# Altium schematic sheet Karta_Radiowa.SchDoc: Karta_L1
size A3
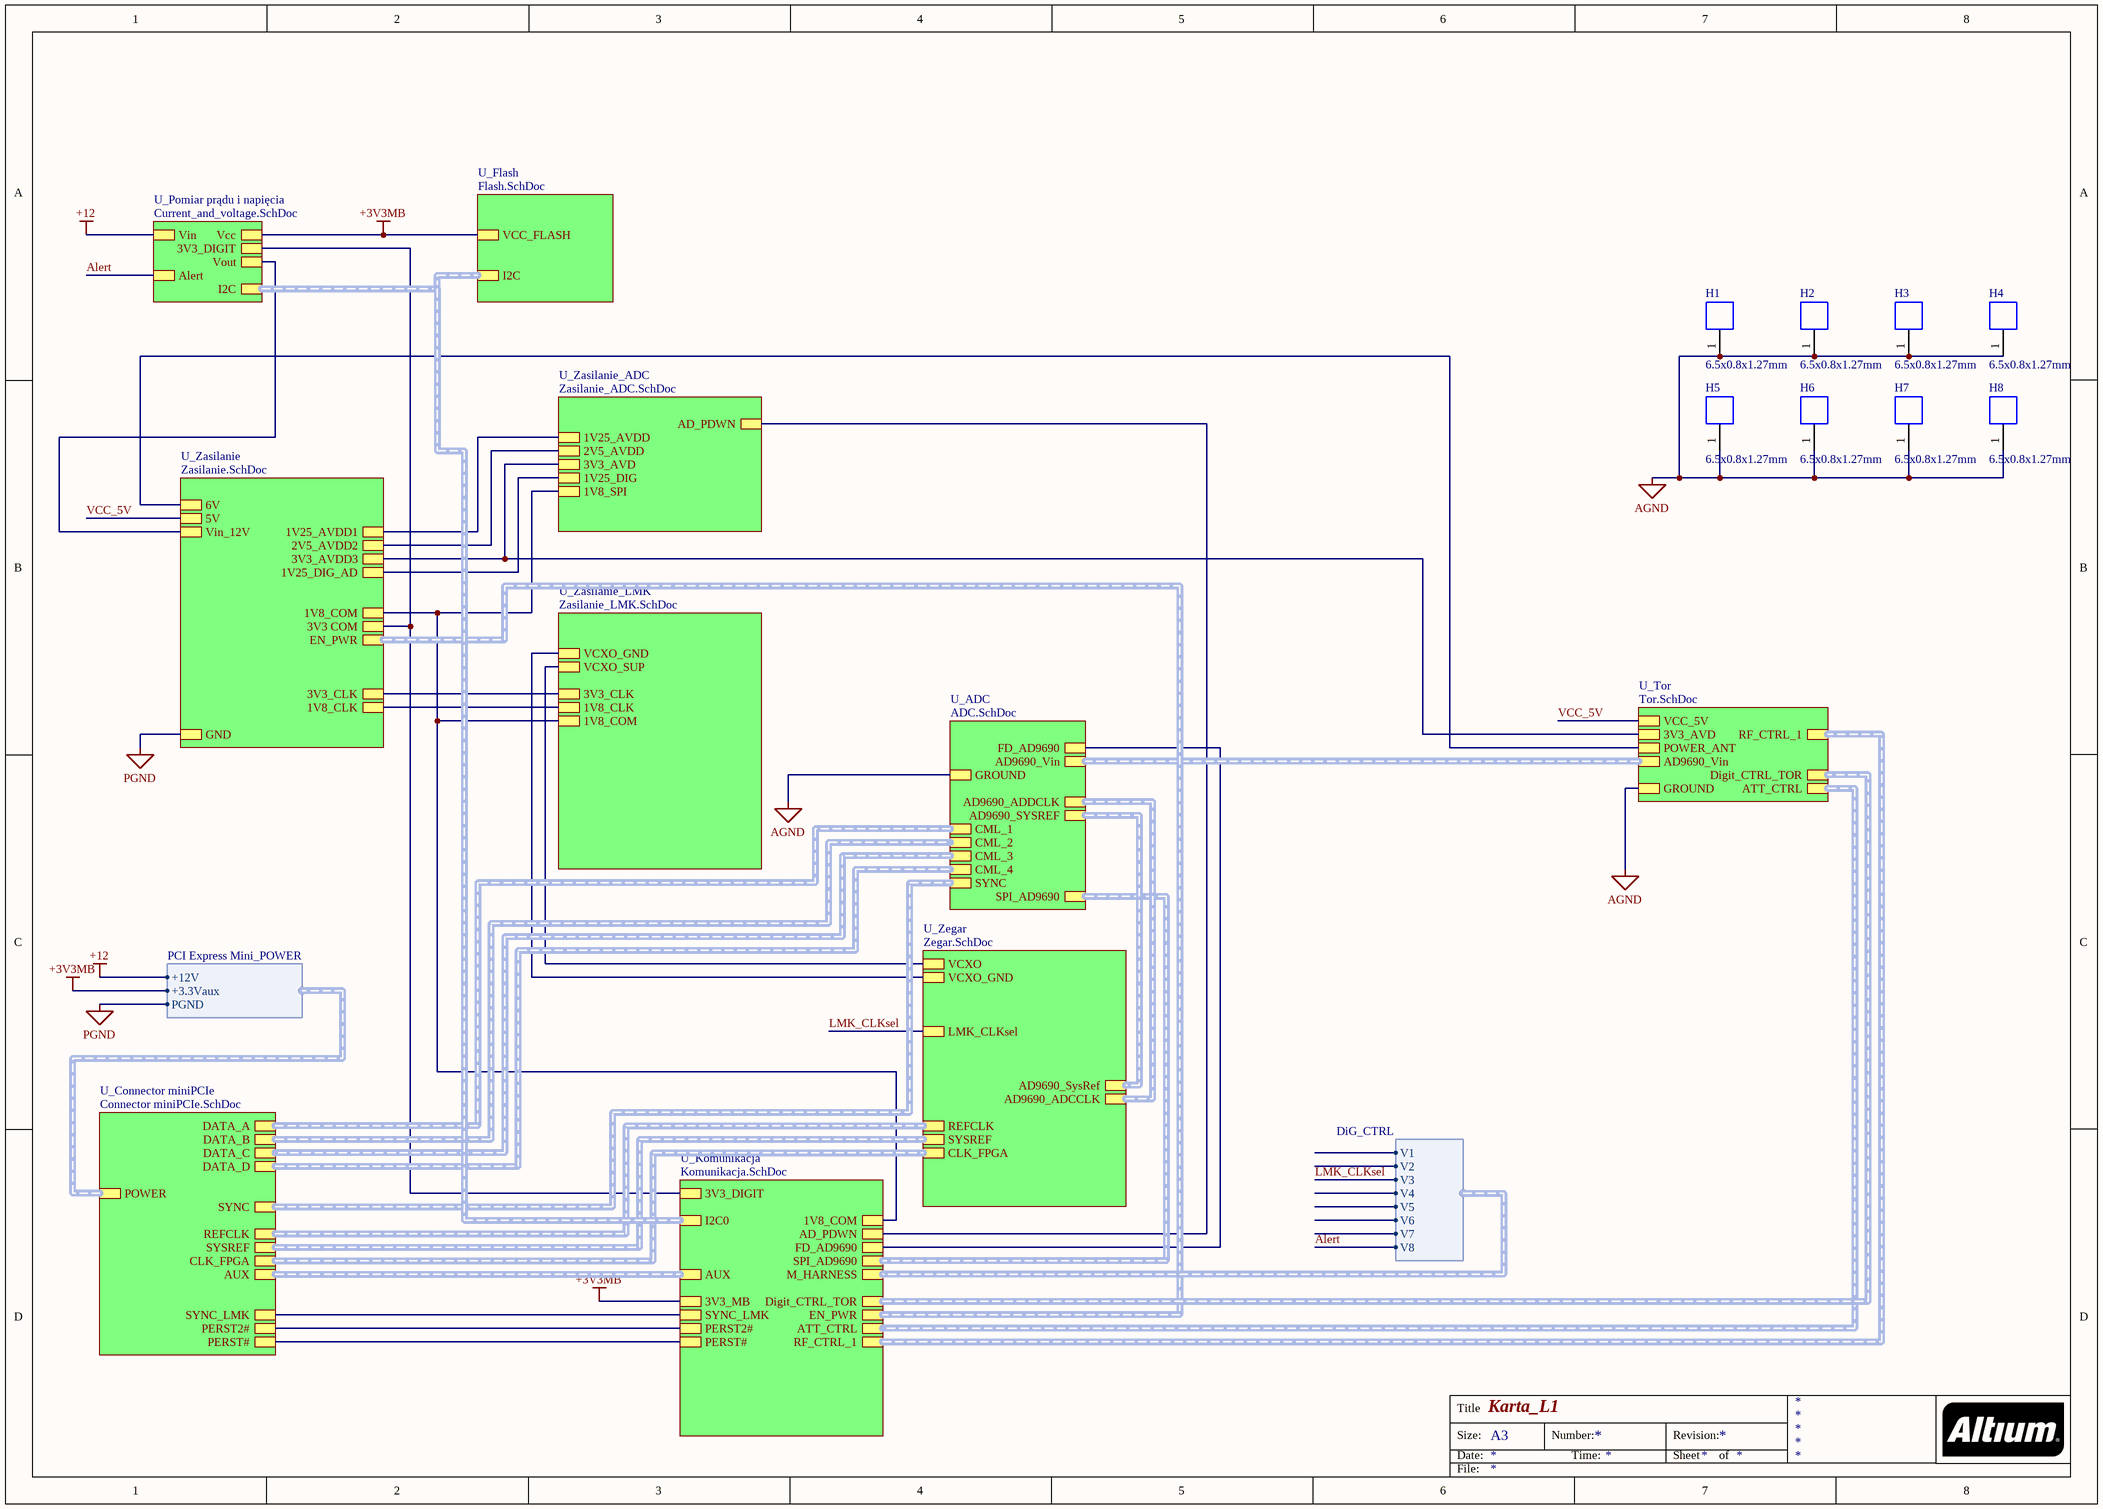
[diagram p0: Karta_Radiowa.SchDoc]

## Parts
H1  6.5x0.8x1.27mm  [36900000]
H2  6.5x0.8x1.27mm  [36900000]
H3  6.5x0.8x1.27mm  [36900000]
H4  6.5x0.8x1.27mm  [36900000]
H5  6.5x0.8x1.27mm  [36900000]
H6  6.5x0.8x1.27mm  [36900000]
H7  6.5x0.8x1.27mm  [36900000]
H8  6.5x0.8x1.27mm  [36900000]

## Sub-sheets
U_ADC = ADC.SchDoc: AD9690_Vin (harness Diff_Anal), GROUND, AD9690_ADDCLK (harness Diff_Dig), AD9690_SYSREF (harness Diff_Digit), CML_4 (harness DATA_OUT), CML_3 (harness DATA_OUT), CML_1 (harness DATA_OUT), CML_2 (harness DATA_OUT), SYNC (harness CLK_DIFF), SPI_AD9690 (harness SPI), FD_AD9690
U_Connector miniPCIe = Connector miniPCIe.SchDoc: POWER (harness PCI Express Mini_POWER), AUX (harness PCI Express Mini_AUXILIARY), REFCLK (harness CLK_DIFF), SYNC (harness CLK_DIFF), SYSREF (harness CLK_DIFF), DATA_A (harness DATA_OUT), PERST#, PERST2#, SYNC_LMK, DATA_B (harness DATA_OUT), DATA_C (harness DATA_OUT), DATA_D (harness DATA_OUT), CLK_FPGA (harness CLK_DIFF)
U_Flash = Flash.SchDoc: VCC_FLASH, I2C (harness I2C)
U_Komunikacja = Komunikacja.SchDoc: I2C0 (harness I2C), PERST#, AUX (harness PCI Express Mini_AUXILIARY), 3V3_MB, PERST2#, SYNC_LMK, 3V3_DIGIT, ATT_CTRL (harness ATT_Controle), Digit_CTRL_TOR (harness DiG_CTRL), EN_PWR (harness Enable_POWER), M_HARNESS (harness DiG_CTRL), SPI_AD9690 (harness SPI), FD_AD9690, AD_PDWN, 1V8_COM, RF_CTRL_1 (harness RF_CTRL)
U_Pomiar prądu i napięcia = Current_and_voltage.SchDoc: Alert, Vin, Vout, Vcc, I2C (harness I2C), 3V3_DIGIT
U_Tor = Tor.SchDoc: AD9690_Vin (harness Diff_Anal), GROUND, VCC_5V, ATT_CTRL (harness ATT_Controle), Digit_CTRL_TOR (harness DiG_CTRL), POWER_ANT, RF_CTRL_1, 3V3_AVD
U_Zasilanie = Zasilanie.SchDoc: Vin_12V, GND, EN_PWR (harness Enable_POWER), 1V25_AVDD1, 1V25_DIG_AD, 1V8_CLK, 2V5_AVDD2, 3V3_AVDD3, 5V, 3V3_CLK, 6V, 1V8_COM, 3V3 COM
U_Zasilanie_ADC = Zasilanie_ADC.SchDoc: 1V25_AVDD, 2V5_AVDD, 3V3_AVD, 1V25_DIG, AD_PDWN, 1V8_SPI
U_Zasilanie_LMK = Zasilanie_LMK.SchDoc: 3V3_CLK, 1V8_CLK, VCXO_GND, VCXO_SUP, 1V8_COM
U_Zegar = Zegar.SchDoc: VCXO, VCXO_GND, LMK_CLKsel, AD9690_ADCCLK (harness Diff_Dig), AD9690_SysRef (harness Diff_Dig), REFCLK (harness CLK_DIFF), SYSREF (harness CLK_DIFF), CLK_FPGA (harness CLK_DIFF)

## Harnesses
DiG_CTRL: V1, V2, V3, V4, V5, V6, V7, V8
PCI Express Mini_POWER: +3.3Vaux, PGND, +12V

## Nets
+3V3MB: sheet U_Komunikacja/3V3_MB, sheet U_Pomiar prądu i napięcia/Vcc, sheet U_Flash/VCC_FLASH, sheet U_Connector miniPCIe/POWER.+3.3Vaux
+12: sheet U_Pomiar prądu i napięcia/Vin, sheet U_Connector miniPCIe/POWER.+12V
AGND: H1.1 H2.1 H3.1 H4.1 H5.1 H6.1 H7.1 H8.1 ; sheet U_ADC/GROUND, sheet U_Tor/GROUND
PGND: sheet U_Zasilanie/GND, sheet U_Connector miniPCIe/POWER.PGND
Alert: sheet U_Pomiar prądu i napięcia/Alert, sheet U_Komunikacja/M_HARNESS.V8
LMK_CLKsel: sheet U_Zegar/LMK_CLKsel, sheet U_Komunikacja/M_HARNESS.V3
VCC_5V: sheet U_Tor/VCC_5V, sheet U_Zasilanie/5V
(unnamed): sheet U_ADC/FD_AD9690, sheet U_Komunikacja/FD_AD9690
(unnamed): sheet U_Komunikacja/PERST#, sheet U_Connector miniPCIe/PERST#
(unnamed): sheet U_Komunikacja/PERST2#, sheet U_Connector miniPCIe/PERST2#
(unnamed): sheet U_Komunikacja/SYNC_LMK, sheet U_Connector miniPCIe/SYNC_LMK
(unnamed): sheet U_Komunikacja/3V3_DIGIT, sheet U_Zasilanie/3V3 COM, sheet U_Pomiar prądu i napięcia/3V3_DIGIT
(unnamed): sheet U_Komunikacja/AD_PDWN, sheet U_Zasilanie_ADC/AD_PDWN
(unnamed): sheet U_Komunikacja/1V8_COM, sheet U_Zasilanie/1V8_COM, sheet U_Zasilanie_ADC/1V8_SPI, sheet U_Zasilanie_LMK/1V8_COM
(unnamed): sheet U_Tor/POWER_ANT, sheet U_Zasilanie/6V
(unnamed): sheet U_Tor/3V3_AVD, sheet U_Zasilanie/3V3_AVDD3, sheet U_Zasilanie_ADC/3V3_AVD
(unnamed): sheet U_Zasilanie/Vin_12V, sheet U_Pomiar prądu i napięcia/Vout
(unnamed): sheet U_Zasilanie/1V25_AVDD1, sheet U_Zasilanie_ADC/1V25_AVDD
(unnamed): sheet U_Zasilanie/1V25_DIG_AD, sheet U_Zasilanie_ADC/1V25_DIG
(unnamed): sheet U_Zasilanie/1V8_CLK, sheet U_Zasilanie_LMK/1V8_CLK
(unnamed): sheet U_Zasilanie/2V5_AVDD2, sheet U_Zasilanie_ADC/2V5_AVDD
(unnamed): sheet U_Zasilanie/3V3_CLK, sheet U_Zasilanie_LMK/3V3_CLK
(unnamed): sheet U_Zegar/VCXO, sheet U_Zasilanie_LMK/VCXO_SUP
(unnamed): sheet U_Zegar/VCXO_GND, sheet U_Zasilanie_LMK/VCXO_GND

## Buses and harness runs
harness sheet U_ADC/AD9690_ADDCLK = sheet U_Zegar/AD9690_ADCCLK
harness sheet U_ADC/AD9690_SYSREF = sheet U_Zegar/AD9690_SysRef
harness sheet U_ADC/AD9690_Vin = sheet U_Tor/AD9690_Vin
harness sheet U_ADC/CML_1 = sheet U_Connector miniPCIe/DATA_A
harness sheet U_ADC/CML_2 = sheet U_Connector miniPCIe/DATA_B
harness sheet U_ADC/CML_3 = sheet U_Connector miniPCIe/DATA_C
harness sheet U_ADC/CML_4 = sheet U_Connector miniPCIe/DATA_D
harness sheet U_ADC/SPI_AD9690 = sheet U_Komunikacja/SPI_AD9690
harness sheet U_ADC/SYNC = sheet U_Connector miniPCIe/SYNC
harness sheet U_Connector miniPCIe/AUX = sheet U_Komunikacja/AUX
harness sheet U_Connector miniPCIe/CLK_FPGA = sheet U_Zegar/CLK_FPGA
harness sheet U_Connector miniPCIe/REFCLK = sheet U_Zegar/REFCLK
harness sheet U_Connector miniPCIe/SYSREF = sheet U_Zegar/SYSREF
harness sheet U_Flash/I2C = sheet U_Komunikacja/I2C0 = sheet U_Pomiar prądu i napięcia/I2C
harness sheet U_Komunikacja/ATT_CTRL = sheet U_Tor/ATT_CTRL
harness sheet U_Komunikacja/Digit_CTRL_TOR = sheet U_Tor/Digit_CTRL_TOR
harness sheet U_Komunikacja/EN_PWR = sheet U_Zasilanie/EN_PWR
harness sheet U_Komunikacja/RF_CTRL_1 = sheet U_Tor/RF_CTRL_1

## Notes on the sheet
- Title
- Size:
- Date:
- A3
- Number:
- Time:
- Revision:
- Sheet
- of
- File:

## Library data of the parts
H1-H8 = 36900000: WE-SHC Shielding Cabinet, Clip, 6.5x0.8x1.27mm; Manufacturer: Wurth Elektronik; Plating: Tin; Base Material: Steel; ComponentLink1Description: Manufacturer; ComponentLink1URL: http://www.we-online.de; ComponentLink2Description: Datasheet; ComponentLink2URL: https://www.we-online.com/catalog/datasheet/36900000.pdf; Operating Temperature: -40 to +125degC; Packaging: Tape and Reel; Length: 6.5mm; Type: Clip; Height: 1.27mm; Manufacturer Part Number: 36900000; Mounting Technology: SMT; Published Date: April 2020; Width: 0.8mm